# Altium schematic sheet main.SchDoc
size 381 x 241 mm; SheetNumber: 1; SheetTotal: 3
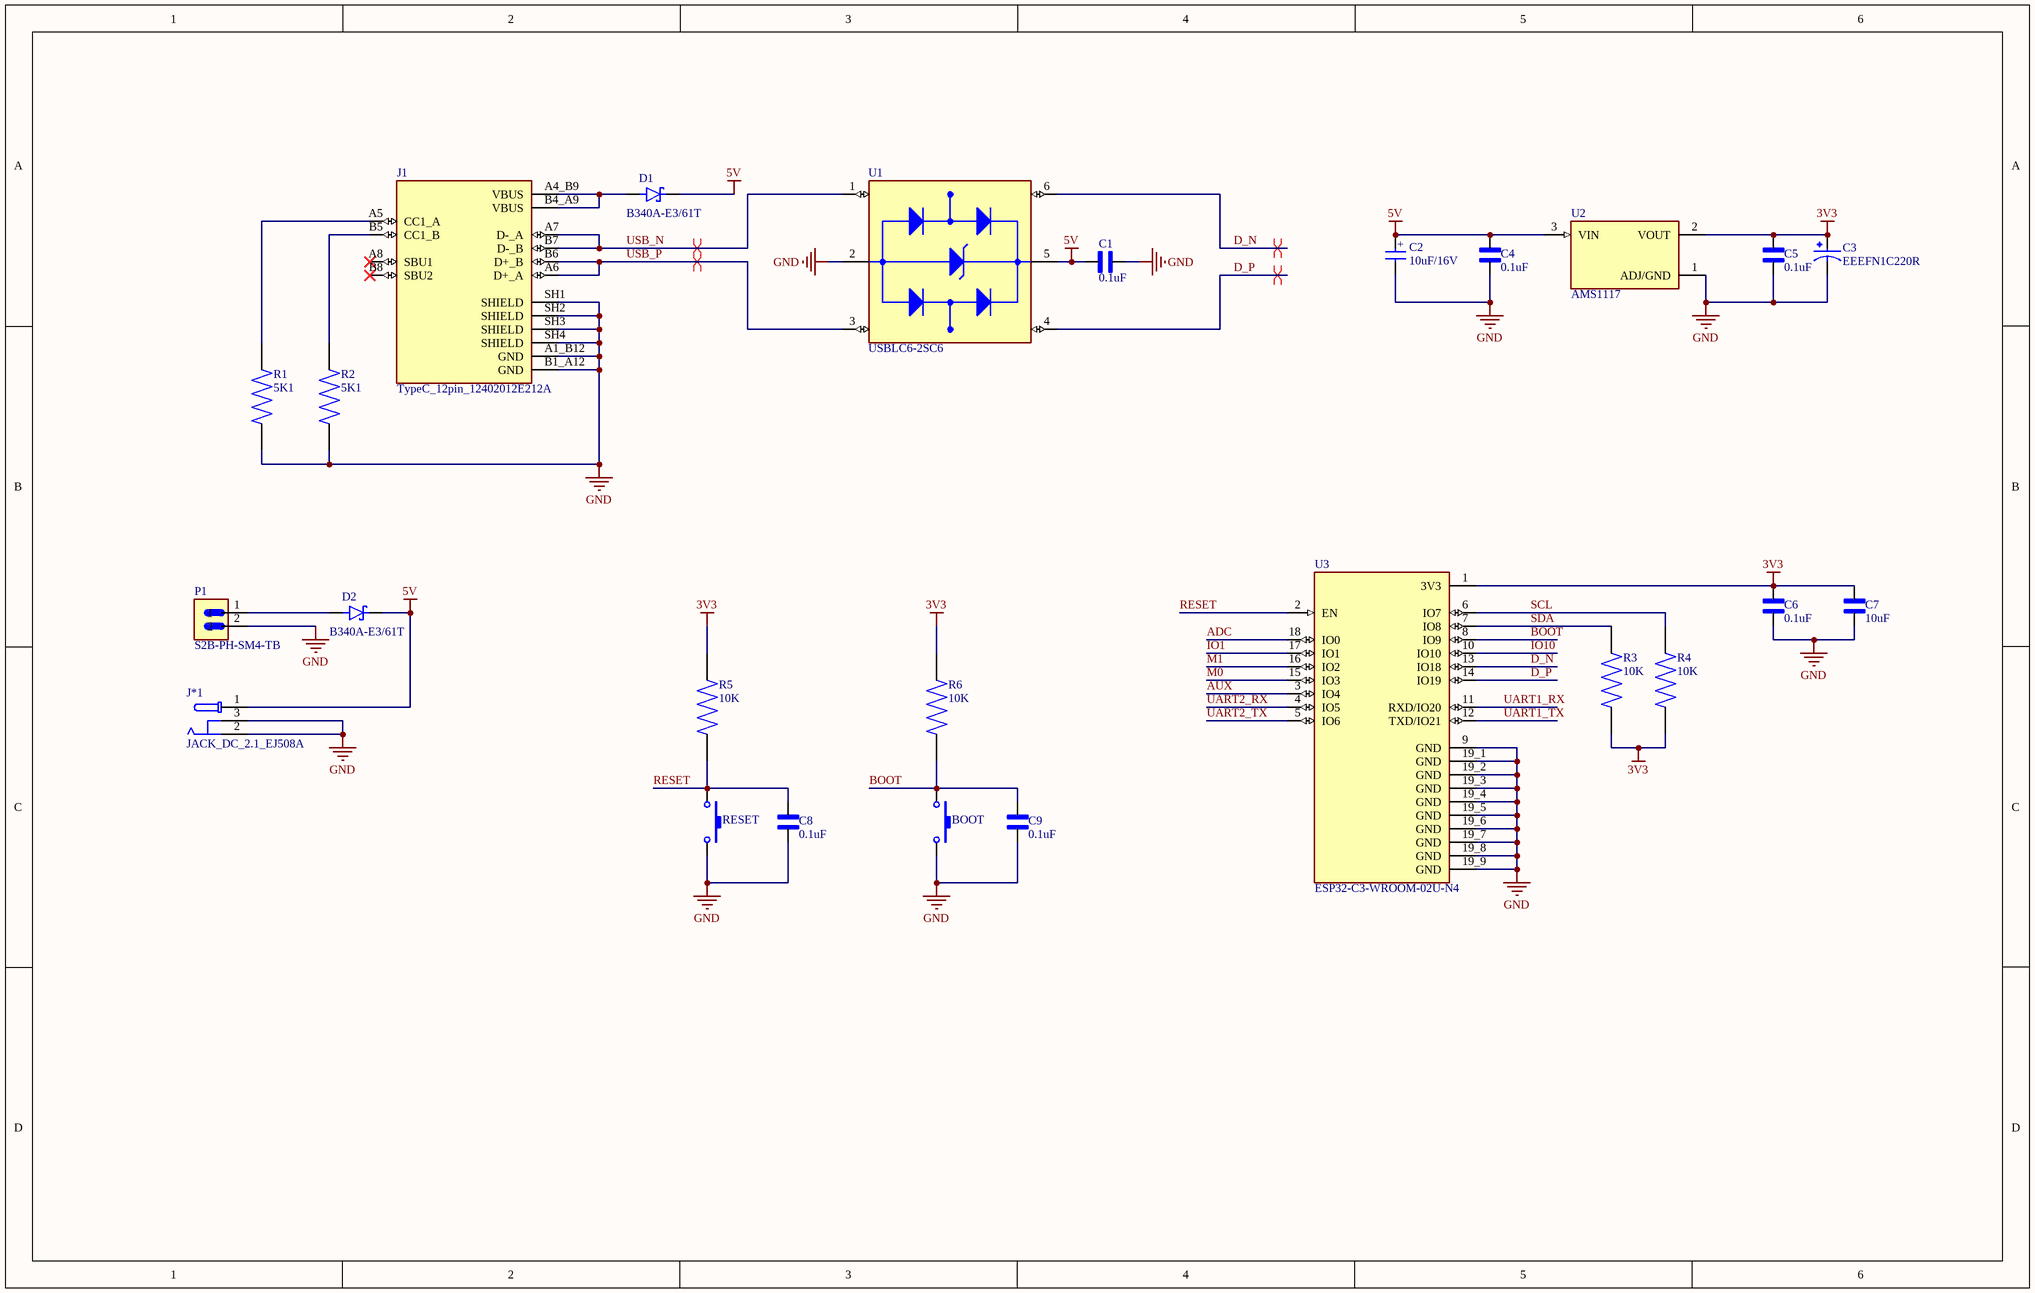
[diagram p0: main.SchDoc]

## Parts
BOOT  Nut Nhan 2 Chan SMD 3x6x2.5  [PCBComponent_1]  (value not drawn)
C1  0.1uF  [CAPC1608X94N]
C2  10uF/16V  [WCAP-AS5H_4X5.5(DXL)]
C3  EEEFN1C220R  [CAP_EEEFN1C220R]
C4  0.1uF  [CAPC1608X94N]
C5  0.1uF  [CAPC1608X94N]
C6  0.1uF  [CAPC1608X94N]
C7  10uF  [CAPC1608X94N]
C8  0.1uF  [CAPC1005X61N]
C9  0.1uF  [CAPC1005X61N]
D1  B340A-E3/61T  [DIOM5126X229N]
D2  B340A-E3/61T  [DIOM5126X229N]
J1  TypeC_12pin_12402012E212A  [TypeC_12pin_12402012E212A]
J*1  JACK_DC_2.1_EJ508A  [MPD_EJ508A]
P1  S2B-PH-SM4-TB  [JST_S2B-PH-SM4-TB]
R1  5K1  [RES_ERJU02F5102X]
R2  5K1  [RES_ERJU02F5102X]
R3  10K  [RES_ERJU02F5102X]
R4  10K  [RES_ERJU02F5102X]
R5  10K  [RES_ERJU02F5102X]
R6  10K  [RES_ERJU02F5102X]
RESET  Nut Nhan 2 Chan SMD 3x6x2.5  [PCBComponent_1]  (value not drawn)
U1  USBLC6-2SC6  [USBLC6-2SC6]
U2  AMS1117  [SOT229P700X180-4N]
U3  ESP32-C3-WROOM-02U-N4  [XCVR_ESP32-C3-WROOM-02U-N4]

## Nets
3V3: C3.1 C5.2 C6.2 C7.2 R3.1 R4.1 R5.1 R6.1 U2.2(VOUT) U3.1(3V3)
5V: C1.2 C2.1(POS) C4.2 D1.C D2.C J*1.1 U1.5(VBUS) U2.3(VIN)
GND: BOOT.2 C1.1 C2.2(NEG) C3.2 C4.1 C5.1 C6.1 C7.1 C8.1 C9.1 J1.A1_B12(GND) J1.B1_A12(GND) J1.SH1(SHIELD) J1.SH2(SHIELD) J1.SH3(SHIELD) J1.SH4(SHIELD) J*1.2 J*1.3 P1.2 R1.1 R2.1 RESET.2 U1.2(GND) U2.1(ADJ/GND) U3.9(GND) U3.19_1(GND) U3.19_2(GND) U3.19_3(GND) U3.19_4(GND) U3.19_5(GND) U3.19_6(GND) U3.19_7(GND) U3.19_8(GND) U3.19_9(GND)
ADC: U3.18(IO0)
AUX: U3.3(IO4)
BOOT: BOOT.1 C9.2 R6.2 U3.8(IO9)
D_N: U1.6(I/O1_OUT) U3.13(IO18)
D_P: U1.4(I/O2_OUT) U3.14(IO19)
IO1: U3.17(IO1)
IO10: U3.10(IO10)
M0: U3.15(IO3)
M1: U3.16(IO2)
RESET: C8.2 R5.2 RESET.1 U3.2(EN)
SCL: R4.2 U3.6(IO7)
SDA: R3.2 U3.7(IO8)
UART1_RX: U3.11(RXD/IO20)
UART1_TX: U3.12(TXD/IO21)
UART2_RX: U3.4(IO5)
UART2_TX: U3.5(IO6)
USB_N: J1.A7(D-_A) J1.B7(D-_B) U1.1(I/O1_IN)
USB_P: J1.A6(D+_A) J1.B6(D+_B) U1.3(I/O2_IN)
NetD1_A: D1.A J1.A4_B9(VBUS) J1.B4_A9(VBUS)
NetD2_A: D2.A P1.1
NetJ1_A5: J1.A5(CC1_A) R1.2
NetJ1_B5: J1.B5(CC1_B) R2.2

Not connected (* = marked no-connect by the designer): J1 A8(SBU1)* B8(SBU2)*

## Layout directives
differential pair: D_N, D_P, USB_N, USB_P

## Notes on the sheet
- (in symbol CAP_10uF_25V_WCAP-AS5H_4X5.5) +

## Library data of the parts
BOOT RESET = Nut Nhan 2 Chan SMD 3x6x2.5: Ma_Hang: MH001036; Ten: Nút Nhấn 2 Chân 3x6x2.5MM SMD
C1 C4-C7 = cap_0603_VJ0603D3R9DXCAP: cap 0603 (1608 Metric); MF: Vishay Vitramon; SnapEDA_Link: https://www.snapeda.com/parts/VJ0603D3R9DXCAP/Vishay/view-part/?ref=snap; Package: 1608 Vishay Vitramon; Value: *; MP: VJ0603D3R9DXCAP; Check_prices: https://www.snapeda.com/parts/VJ0603D3R9DXCAP/Vishay/view-part/?ref=eda
C2 = CAP_10uF_25V_WCAP-AS5H_4X5.5: CAP ALUM 10UF 20% 25V SMD; MF: WÃ¼rth Elektronik; MP: 865230440002; SnapEDA_Link: https://www.snapeda.com/parts/865230440002/W%25C3%25BCrth+Elektronik+Midcom/view-part/?ref=snap; Package: Radial WÃ¼rth Elektronik; Value: *; Check_prices: https://www.snapeda.com/parts/865230440002/W%25C3%25BCrth+Elektronik+Midcom/view-part/?ref=eda
C3 = EEEFN1C220R: CAP ALUM 22UF 20% 16V SMD; MF: Panasonic Electronic Components; MP: EEE-FN1C220R; Package: RADIAL-2 Panasonic; Value: *; Price: None; Check_prices: https://www.snapeda.com/parts/EEE-FN1C220R/Panasonic/view-part/6178704/?ref=eda; Purchase-URL: https://pricing.snapeda.com/search/part/EEE-FN1C220R/?ref=eda; Availability: In Stock; SnapEDA_Link: https://www.snapeda.com/parts/EEE-FN1C220R/Panasonic/view-part/6178704/?ref=snap
C8 C9 = cap_0402_VJ0402D100MXCAP: cap 0402; MF: Vishay Vitramon; SnapEDA_Link: https://www.snapeda.com/parts/VJ0402D100MXCAP/Vishay/view-part/?ref=snap; Package: 1005 Vishay Vitramon; Value: *; MP: VJ0402D100MXCAP; Check_prices: https://www.snapeda.com/parts/VJ0402D100MXCAP/Vishay/view-part/?ref=eda
D1 D2 = B340A-E3/61T: Diode Schottky 40 V 3A Surface Mount DO-214AC (SMA); MF: Vishay Semiconductor; SnapEDA_Link: https://www.snapeda.com/parts/B340A-E3/61T/Vishay/view-part/?ref=snap; Package: DO-214 Vishay Semiconductor; Value: *; MP: B340A-E3/61T; Check_prices: https://www.snapeda.com/parts/B340A-E3/61T/Vishay/view-part/?ref=eda
J1 = TypeC_12pin_12402012E212A: USB2.0, Type C, Top mount, CH 1.68mm, Dual Row SMT; MF: Amphenol ICC (Commercial Products); MP: 12402012E212A; Price: None; Package: None; Availability: In Stock; SnapEDA_Link: https://www.snapeda.com/parts/12402012E212A/Amphenol/view-part/?ref=snap; Value: *; Check_prices: https://www.snapeda.com/parts/12402012E212A/Amphenol/view-part/?ref=eda; Purchase-URL: https://pricing.snapeda.com/search/part/12402012E212A/?ref=eda
J*1 = JACK_DC_2.1_EJ508A: Power Barrel Connector Jack 2.10mm ID _0.083_, 5.50mm OD _0.217_ Through Hole, Right Angle / EJ508A; MF: MPD; Package: Non-Standard MPD; Value: *; SnapEDA_Link: https://www.snapeda.com/parts/EJ508A/MPD%20%28Memory%20Protection%20Devices%29/view-part/474399/?ref=snap; Price: None; MP: EJ508A; Availability: Unavailable
P1 = S2B-PH-SM4-TB: Connector Header Surface Mount, Right Angle 2 position 0.079 (2.00mm); MF: JST Sales; SnapEDA_Link: https://www.snapeda.com/parts/S2B-PH-SM4-TB/JST/view-part/?ref=snap; Package: None; Value: *; MP: S2B-PH-SM4-TB; Check_prices: https://www.snapeda.com/parts/S2B-PH-SM4-TB/JST/view-part/?ref=eda
R1-R6 = res_0402_ERJU02F5102X: Availability: Unavailable; MP: ERJU02F5102X; Price: None; Package: None; Value: *
U1 = USBLC6-2SC6: 17V Clamp 5A (8/20Âµs) Ipp Tvs Diode Surface Mount SOT-23-6; MF: STMicroelectronics; Value: *; SnapEDA_Link: https://www.snapeda.com/parts/USBLC6-2SC6/STMicroelectronics/view-part/?ref=snap; Check_prices: https://www.snapeda.com/parts/USBLC6-2SC6/STMicroelectronics/view-part/?ref=eda; Purchase-URL: https://pricing.snapeda.com/search/part/USBLC6-2SC6/?ref=eda; Price: None; Availability: In Stock; Package: SOT-23-6 STMicroelectronics; MP: USBLC6-2SC6
U2 = AMS1117: 1A LOW DROPOUT VOLTAGE REGULATOR SOT-223; MF: Advanced Monolithic Systems; SnapEDA_Link: https://www.snapeda.com/parts/AMS1117/Advanced+Monolithic+Systems/view-part/?ref=snap; Package: SOT-223 Seeed Technology; Value: *; MP: AMS1117; Check_prices: https://www.snapeda.com/parts/AMS1117/Advanced+Monolithic+Systems/view-part/?ref=eda
U3 = ESP32-C3-WROOM-02U-N4: Bluetooth, WiFi 802.11b/g/n, Bluetooth v5.0 Transceiver Module 2.4GHz Antenna Not Included, U.FL Surface Mount; MF: Espressif Systems; SnapEDA_Link: https://www.snapeda.com/parts/ESP32-C3-WROOM-02U-N4/Espressif+Systems/view-part/?ref=snap; Package: SMD-19 Espressif Systems; Value: *; MP: ESP32-C3-WROOM-02U-N4; Check_prices: https://www.snapeda.com/parts/ESP32-C3-WROOM-02U-N4/Espressif+Systems/view-part/?ref=eda